# Altium schematic sheet 鹿小班--STM32F407VET6-Mini款PCB封装.schdoc
size 127 x 101 mm
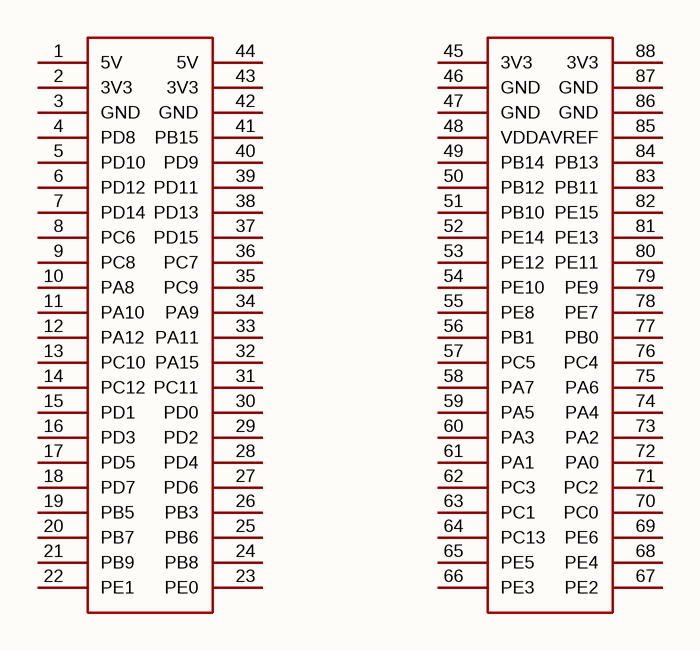
[diagram p0: 鹿小班--STM32F407VET6-Mini款PCB封装.schdoc]

## Parts
U?  鹿小班--stm32f407vet6-mini款pcb封装  [STM32F407VET6-Mini开发板封装]  (value not drawn)

## Nets

Not connected (* = marked no-connect by the designer): U? 1(5V) 2(3V3) 3(GND) 4(PD8) 5(PD10) 6(PD12) 7(PD14) 8(PC6) 9(PC8) 10(PA8) 11(PA10) 12(PA12) 13(PC10) 14(PC12) 15(PD1) 16(PD3) 17(PD5) 18(PD7) 19(PB5) 20(PB7) 21(PB9) 22(PE1) 23(PE0) 24(PB8) 25(PB6) 26(PB3) 27(PD6) 28(PD4) 29(PD2) 30(PD0) 31(PC11) 32(PA15) 33(PA11) 34(PA9) 35(PC9) 36(PC7) 37(PD15) 38(PD13) 39(PD11) 40(PD9) 41(PB15) 42(GND) 43(3V3) 44(5V) 45(3V3) 46(GND) 47(GND) 48(VDDA) 49(PB14) 50(PB12) 51(PB10) 52(PE14) 53(PE12) 54(PE10) 55(PE8) 56(PB1) 57(PC5) 58(PA7) 59(PA5) 60(PA3) 61(PA1) 62(PC3) 63(PC1) 64(PC13) 65(PE5) 66(PE3) 67(PE2) 68(PE4) 69(PE6) 70(PC0) 71(PC2) 72(PA0) 73(PA2) 74(PA4) 75(PA6) 76(PC4) 77(PB0) 78(PE7) 79(PE9) 80(PE11) 81(PE13) 82(PE15) 83(PB11) 84(PB13) 85(VREF) 86(GND) 87(GND) 88(3V3)

## Library data of the parts
U? = 鹿小班--stm32f407vet6-mini款pcb封装: AddInBom: yes; SymbolName: 鹿小班--STM32F407VET6-Mini款PCB封装; FootprintName: STM32F407VET6-Mini开发板封装; ConvertToPcb: yes